# Altium schematic sheet PowerDistribution.SchDoc
size A
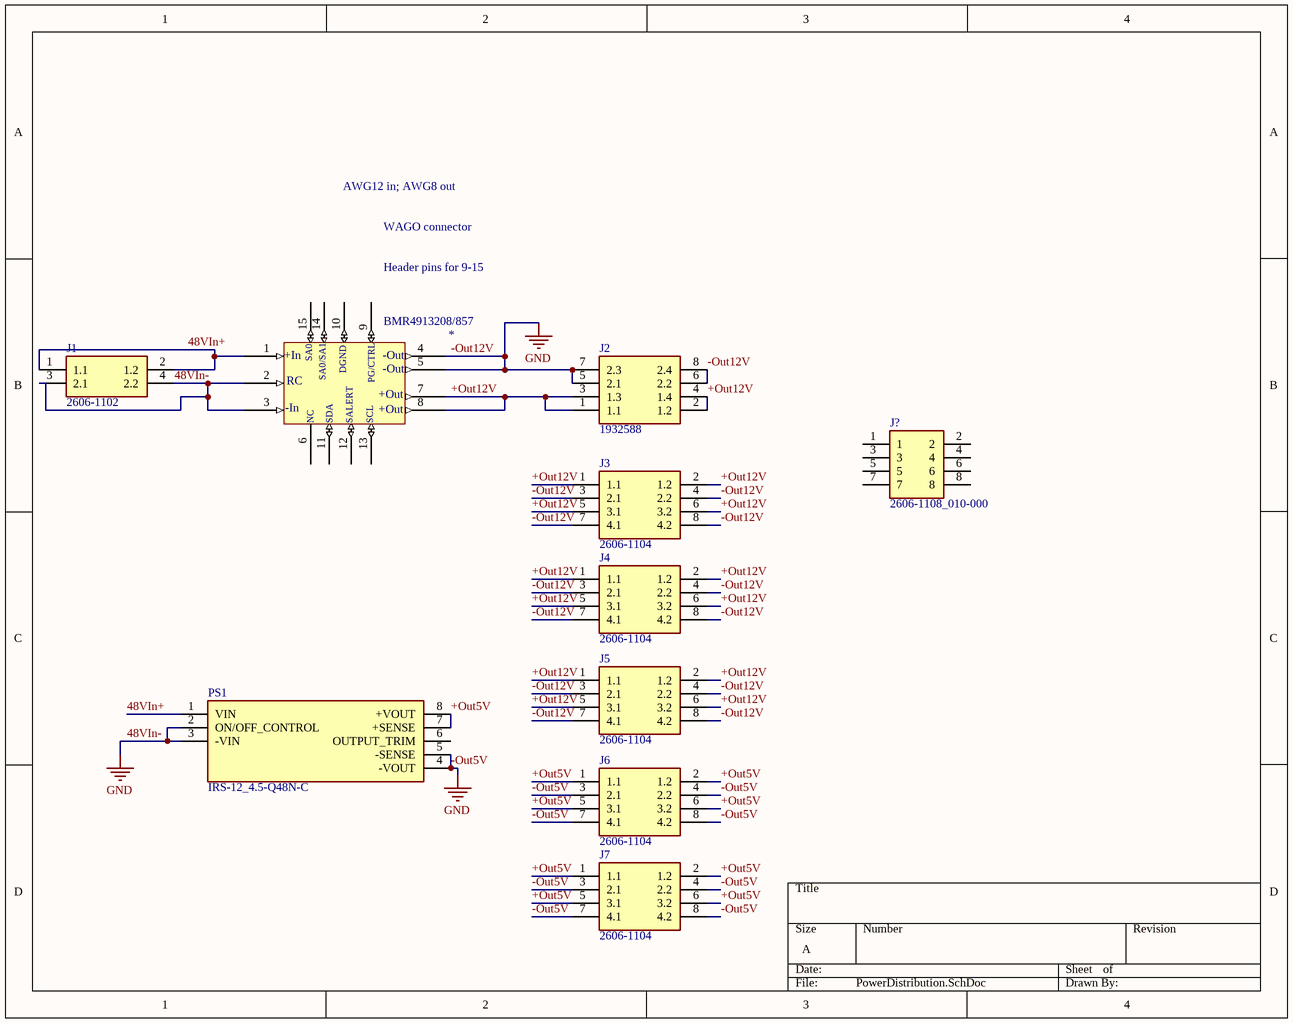
[diagram p0: PowerDistribution.SchDoc]

## Parts
*  BMR4913208/857  [BMR4913208_857-Footprint-1]
J1  2606-1102  [26061102]
J2  1932588  [1932588]
J3  2606-1104  [26061104]
J4  2606-1104  [26061104]
J5  2606-1104  [26061104]
J6  2606-1104  [26061104]
J7  2606-1104  [26061104]
J?  2606-1108_010-000  [26061108010000]
PS1  IRS-12_4.5-Q48N-C  [IRS1245Q48NC]

## Nets
-Out12V: *.2(RC) *.3(-In) *.4(-Out) *.5(-Out) J1.3(2.1) J1.4(2.2) J2.5(2.1) J2.6(2.2) J2.7(2.3) J2.8(2.4) J3.3(2.1) J3.4(2.2) J3.7(4.1) J3.8(4.2) J4.3(2.1) J4.4(2.2) J4.7(4.1) J4.8(4.2) J5.3(2.1) J5.4(2.2) J5.7(4.1) J5.8(4.2) J6.3(2.1) J6.4(2.2) J6.7(4.1) J6.8(4.2) J7.3(2.1) J7.4(2.2) J7.7(4.1) J7.8(4.2) PS1.2(ON/OFF_CONTROL) PS1.3(-VIN) PS1.4(-VOUT) PS1.5(-SENSE)  [also labelled -Out5V, 48VIn-, GND]
48VIn+: *.1(+In) J1.1(1.1) J1.2(1.2) PS1.1(VIN)
+Out5V: J6.1(1.1) J6.2(1.2) J6.5(3.1) J6.6(3.2) J7.1(1.1) J7.2(1.2) J7.5(3.1) J7.6(3.2) PS1.7(+SENSE) PS1.8(+VOUT)
+Out12V: *.7(+Out) *.8(+Out) J2.1(1.1) J2.2(1.2) J2.3(1.3) J2.4(1.4) J3.1(1.1) J3.2(1.2) J3.5(3.1) J3.6(3.2) J4.1(1.1) J4.2(1.2) J4.5(3.1) J4.6(3.2) J5.1(1.1) J5.2(1.2) J5.5(3.1) J5.6(3.2)

Not connected (* = marked no-connect by the designer): * 6(NC) 9(PG/CTRL) 10(DGND) 11(SDA) 12(SALERT) 13(SCL) 14(SA0/SA1) 15(SA0); J? 1 2 3 4 5 6 7 8; PS1 6(OUTPUT_TRIM)

## Notes on the sheet
- AWG12 in; AWG8 out
- WAGO connector
- Header pins for 9-15

## Library data of the parts
* = CMP-019-00049-3: 48-60VIN; 12VOUT; 1540W; 2450W P
J1 = 2606-1102: Connector; Manufacturer_Name: Wago; Datasheet Link: https://www.wago.com/global/pcb-terminal-blocks-and-pluggable-connectors/pcb-terminal-block/p/2606-1102; Height: 24mm; Manufacturer_Part_Number: 2606-1102
J2 = 1932588: Connector - Speed Controller; Manufacturer_Name: Phoenix Contact; Datasheet Link: https://datasheet.datasheetarchive.com/originals/distributors/SFDatasheet-2/sf-00057397.pdf; Height: 39.2mm; Manufacturer_Part_Number: 1932588; Mouser Part Number: 651-1932588; Mouser Price/Stock: https://www.mouser.co.uk/ProductDetail/Phoenix-Contact/1932588?qs=zGjMOL9s0Z%252BnZxcpLOCAEA%3D%3D; Arrow Part Number: 1932588; Arrow Price/Stock: https://www.arrow.com/en/products/1932588/phoenix-contact?region=nac
J3 = 2606-1104: Connector - Light and DVL; Manufacturer_Name: Wago; Datasheet Link: https://www.wago.com/2606-1104; Height: 24mm; Manufacturer_Part_Number: 2606-1104
J4 = 2606-1104: Connector - Gripper and Jetson; Manufacturer_Name: Wago; Datasheet Link: https://www.wago.com/2606-1104; Height: 24mm; Manufacturer_Part_Number: 2606-1104
J5 = 2606-1104: Connector - Extra; Manufacturer_Name: Wago; Datasheet Link: https://www.wago.com/2606-1104; Height: 24mm; Manufacturer_Part_Number: 2606-1104
J6 J7 = 2606-1104: Connector; Manufacturer_Name: Wago; Datasheet Link: https://www.wago.com/2606-1104; Height: 24mm; Manufacturer_Part_Number: 2606-1104
J? = 2606-1108_010-000: Connector; Manufacturer_Name: Wago; Manufacturer_Part_Number: 2606-1108/010-000; Datasheet Link: https://www.wago.com/2606-1108/010-000; Height: 24mm
PS1 = IRS-12_4.5-Q48N-C: Power Supply; Manufacturer_Name: Murata Electronics; Manufacturer_Part_Number: IRS-12/4.5-Q48N-C; Datasheet Link: https://power.murata.com/data/power/irs-q48.pdf; Height: 13.2mm; Mouser Part Number: 580-IRS12/4.5-Q48NC; Mouser Price/Stock: https://www.mouser.co.uk/ProductDetail/Murata-Power-Solutions/IRS-12-4.5-Q48N-C?qs=f9yNj16SXrJShYYebNX1QA%3D%3D; Arrow Part Number: IRS-12/4.5-Q48N-C; Arrow Price/Stock: https://www.arrow.com/en/products/irs-124.5-q48n-c/murata-power-solutions?region=nac